# EAGLE design S-Link Bridge v1.0 (EAGLE 7.6.0)
REV: 1
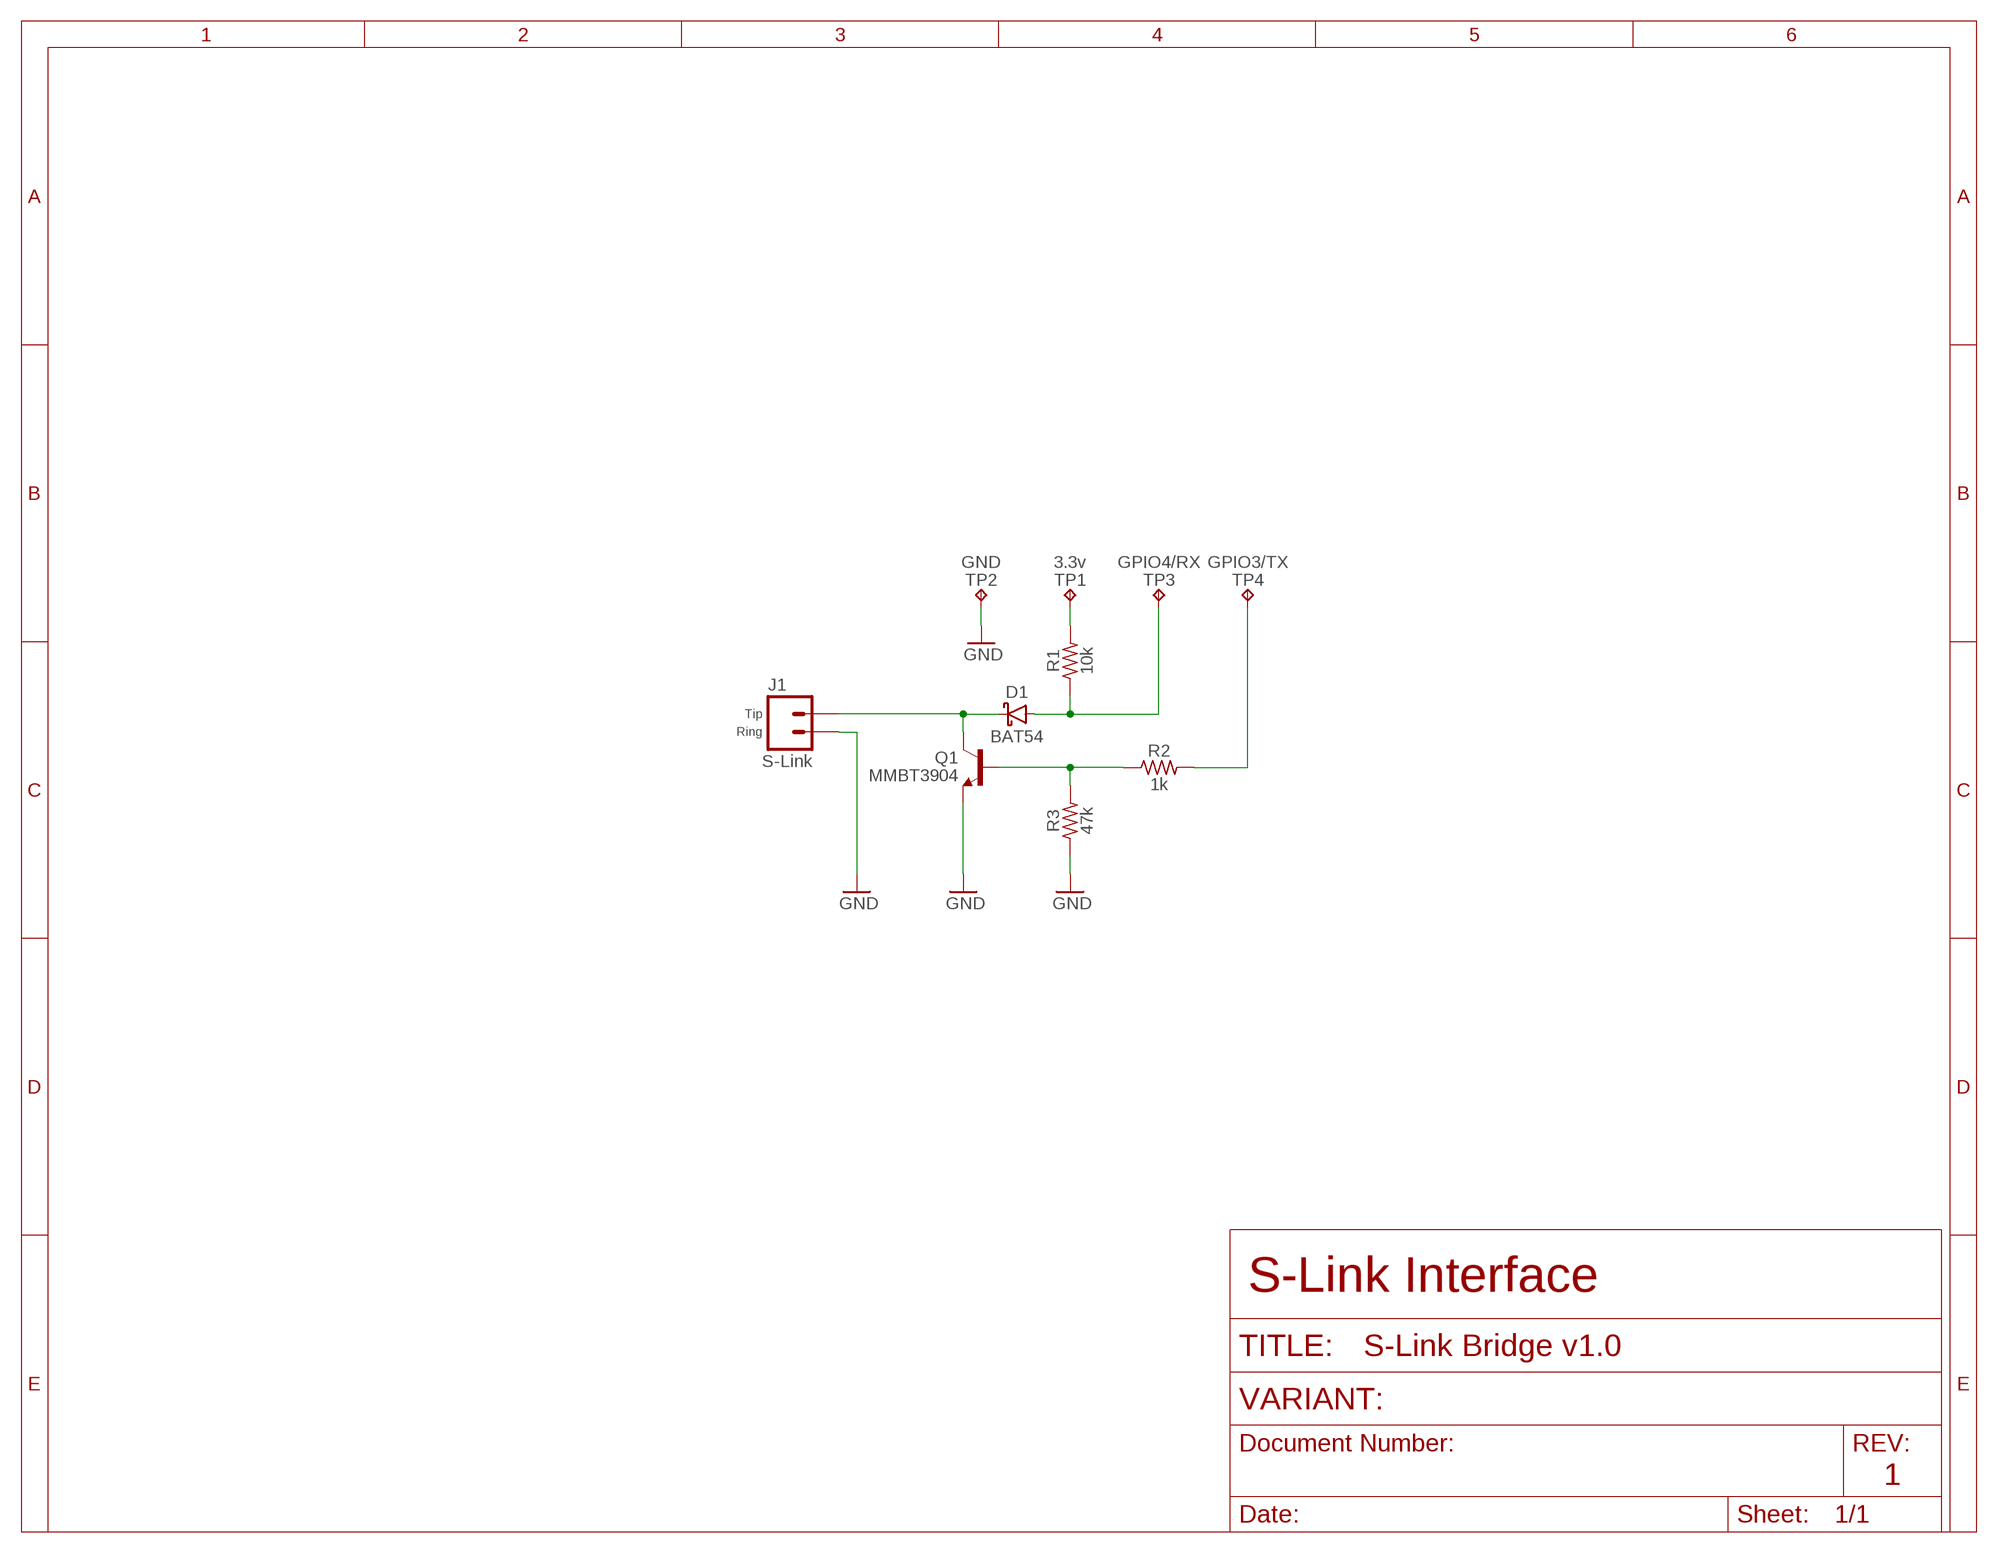
[diagram p0: schematic, sheet 1]
FRAME1 (FRAME_A_L): DESCRIPTION: S-Link Interface

## Parts
D1  BAT54  DIODE-SCHOTTKY-SOD123  [SOD-123]
J1  S-Link  M02PTH  [1X02]
Q1  MMBT3904  TRANSISTOR-NPN  [SOT23]
R1  10k  RESISTORR0603  [R0603]
R2  1k  RESISTORR0603  [R0603]
R3  47k  RESISTORR0603  [R0603]
TP1  3.3v  TPPAD1-10  [P1-10]
TP2  GND  TPPAD1-10  [P1-10]
TP3  GPIO4/RX  TPPAD1-10  [P1-10]
TP4  GPIO3/TX  TPPAD1-10  [P1-10]

## Nets
GND: J1.2 Q1.2(E) R3.1 TP2.TP
N$1: D1.C J1.1 Q1.3(C)
N$2: D1.A R1.1 TP3.TP
N$3: R1.2 TP1.TP
N$4: Q1.1(B) R2.1 R3.2
N$5: R2.2 TP4.TP

## Library data of the parts
D1 = Skoba:DIODE-SCHOTTKY: Schottky diodes in SFE's production catalog BAT20J 1A 23V 0.62Vf RB751 120mA 40V 0.37Vf PMEG4005EJ 0.5A 40V 0.42Vf MBRA140 1A 40V 0.5Vf B340A 3A 40V SMA
J1 = Skoba:M02: Standard 2-pin 0.1" header. Use with - straight break away headers ( PRT-00116) - right angle break away headers (PRT-00553) - swiss pins (PRT-00743) - machine pins (PRT-00117) - female headers (PRT-00115) Molex polarized connector foot print use with: PRT-08233 with associated crimp pins and housings. 2.54_SCREWTERM for use with PRT-10571. 3.5mm Screw Terminal footprints for PRT-08084 5mm Screw Terminal footprints for use with PRT-08432; PIN1: Tip; PIN2: Ring; VALSTAT: LABEL
Q1 = Skoba:TRANSISTOR-NPN
R1-R3 = Skoba:RESISTOR: RESISTOR, American symbol
TP1-TP4 = Skoba:TP: Test pad; BOM: EXCLUDE

## Board
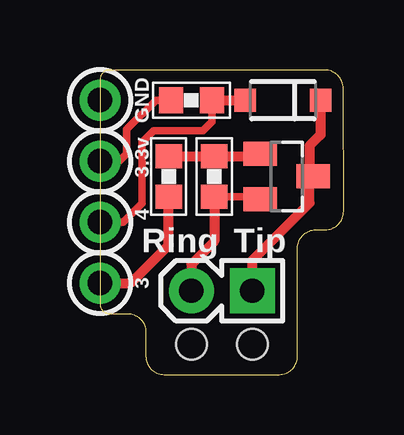
[diagram p1: board, top side]
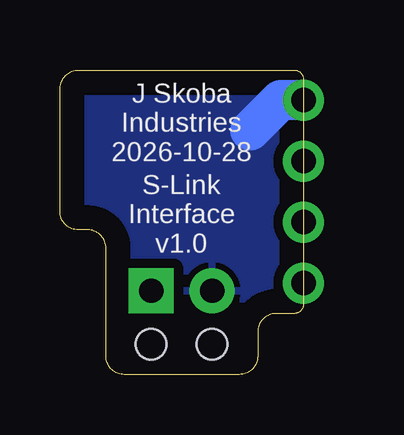
[diagram p2: board, bottom side, seen from below]

Size 10.16 x 12.69 mm. Coordinates in mm from the lower left corner, seen from the top.
Outline: 0.38,2.54 1.14,2.54 arc-90 1.91,1.78 1.91,0.76 arc90 2.67,0 7.47,0 arc90 8.23,0.76 8.23,5.27 arc-90 9,6.03 9.4,6.03 arc90 10.16,6.8 10.14,11.93 arc90 9.38,12.69 0.38,12.69 arc90 0,12.31 0,2.92 arc90 0.38,2.54
Copper layers (1*16): Top 0.035mm / dielectric 1.5mm / Bottom 0.035mm
Design rules "default": minimum track width 10mil, minimum drill 24mil, track to track 8mil, track to pad 8mil, pad to pad 8mil, via to via 8mil, smd to smd 8mil, copper to edge 40mil, drill to drill 8mil, minimum pad ring 10mil, minimum via ring 8mil, stop-mask expansion 4mil, vias tented up to drill 0mil, thermal gap 10mil
Holes 1.27 mm at 3.81,1.27 6.35,1.27

### Footprints (pad centres in the part's own frame; a part is rotated, then mirrored left to right if it is on the bottom)
SOD-123 = smd 0.9 x 0.95: A 1.575,0; C -1.575,0
1X02 = drill 1.016 pad 1.88 square: 1 0,0 | drill 1.016 pad 1.88: 2 2.54,0
SOT23 = smd 1 x 1.4: 1 -0.95,-1.1; 2 0.95,-1.1; 3 0,1.1
R0603 = smd 1 x 1.1: 1 -0.85,0; 2 0.85,0
P1-10 = drill 1.02 pad 1.7: TP 0,0

### Placement (x,y rotation side)
D1  7.62,11.43 180 top
J1  6.35,3.49 180 top
Q1  7.78,8.26 270 top
R1  3.81,11.43 180 top
R2  2.86,8.26 270 top
R3  4.76,8.26 90 top
TP1  0,8.89 0 top
TP2  0,11.43 0 top
TP3  0,6.35 0 top
TP4  0,3.81 0 top

### Tracks (layer width: path | path; a pad name or v marks a point on that pad's centre or on a via)
GND
  Top 0.305: R3.1 6.42,7.41 Q1.2
  Top 0.406: R3.1 4.76,5.56 3.81,4.6 J1.2
  Bottom 1.676: TP2.TP 0.95,11.43 2.22,10.16
  pour Bottom (isolate 0.406): 0,13.97 10.16,13.97 10.16,-1.27 0,-1.27
N$1
  Top 0.305: 8.73,8.24 Q1.3 8.73,8.27
  Top 0.406: J1.1 6.35,4.76 8.73,7.14 8.73,8.24 | D1.C 9.2,9.99 8.73,9.53 8.73,8.27
N$2
  Top 0.305: TP3.TP 0.95,6.35 1.75,7.14 1.75,9.68 2.22,10.16 4.29,10.16 4.66,10.53 R1.1
  Top 0.406: R1.1 D1.A
N$3
  Top 0.305: TP1.TP 0.79,8.89 1.11,9.21 1.11,10.22 2.33,11.43 R1.2
N$4
  Top 0.305: 6.42,9.11 Q1.1
  Top 0.406: R2.1 R3.2 6.42,9.11
N$5
  Top 0.406: TP4.TP 1.27,3.81 2.86,5.4 R2.2

### Text on the board
tPlace: GND | 3.3v | 4 | Ring | Tip | 3
bPlace: J Skoba / Industries / 2026-10-28 | S-Link / Interface / v1.0